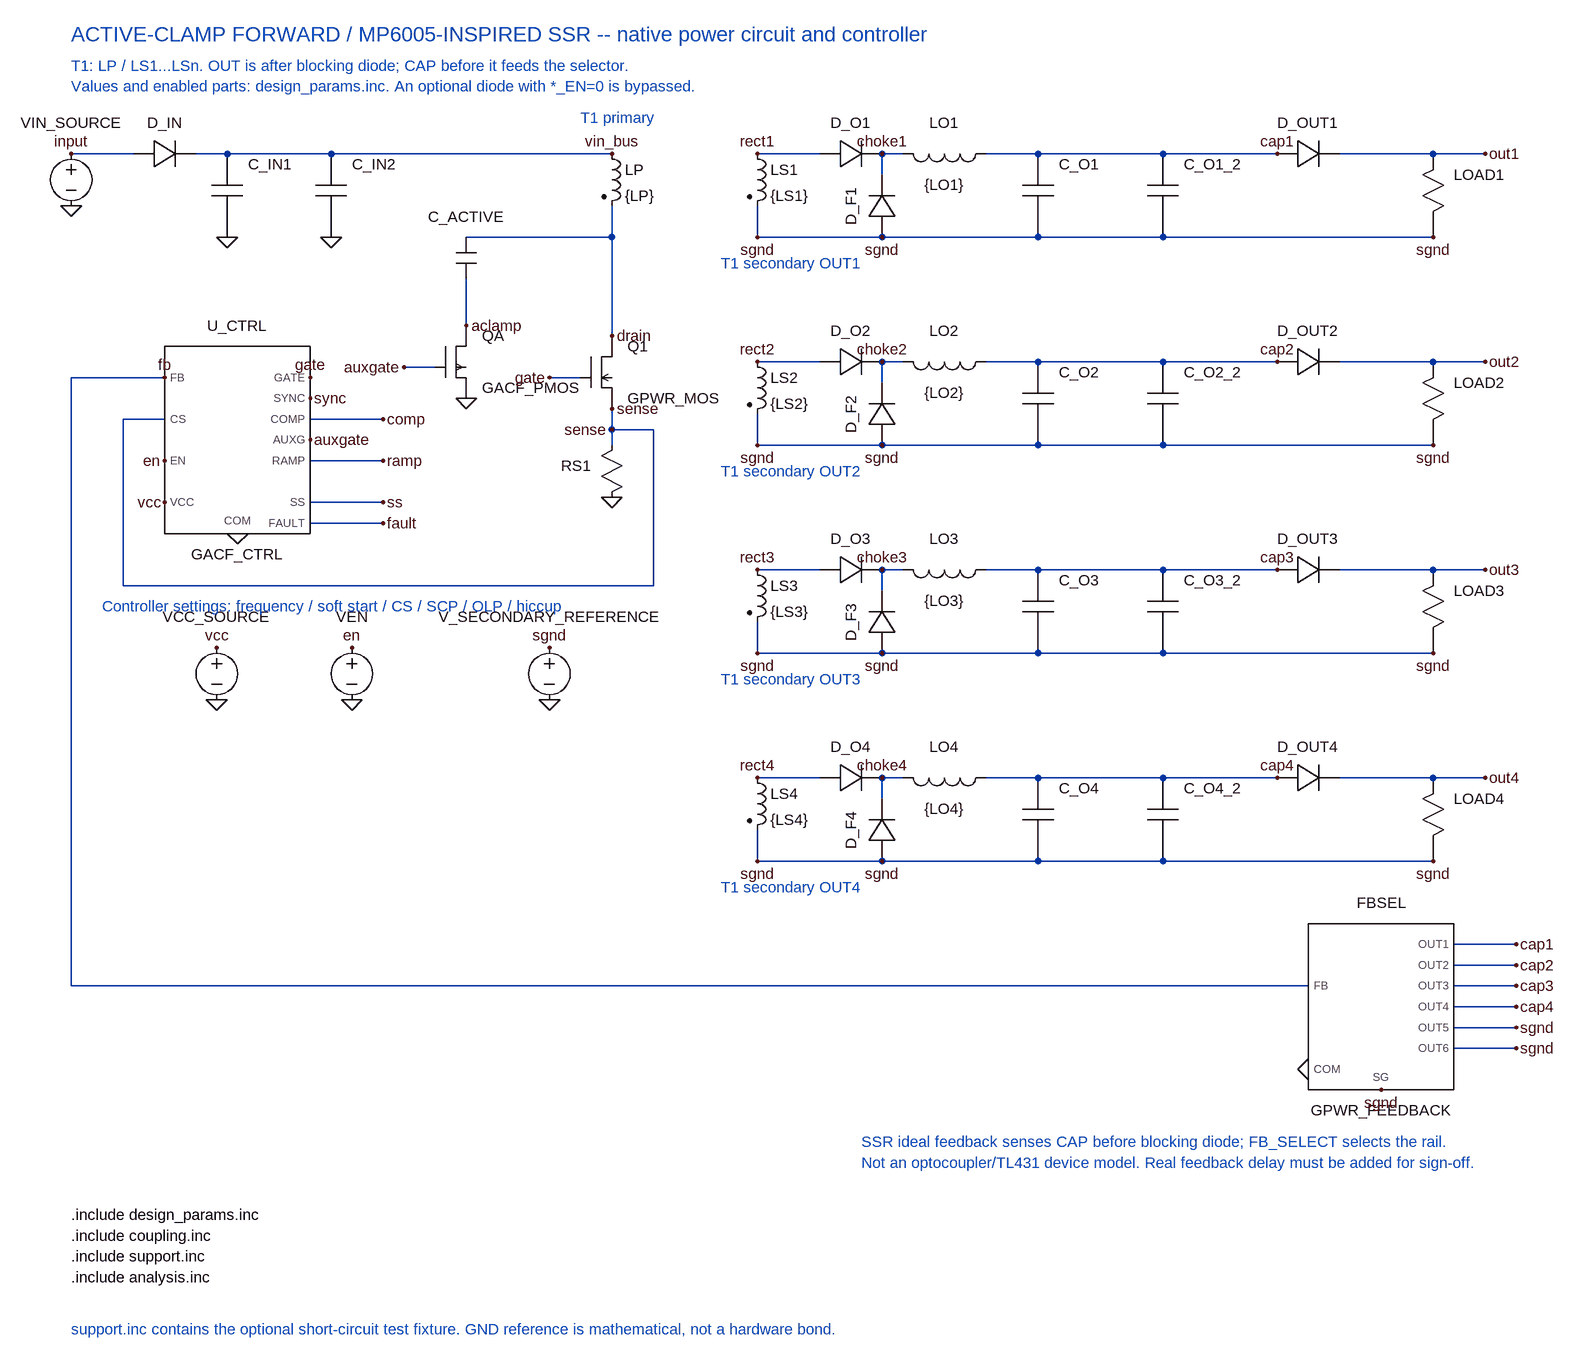
[diagram p0: schematic ACF_Forward_4.asc]
ACF_Forward_4.asc, the LTspice schematic file:
Version 4
SHEET 1 880 680
WIRE 64 200 160 200
WIRE 256 200 896 200
WIRE 896 280 896 480
WIRE 896 592 896 648
WIRE 208 608 144 608
WIRE 144 608 144 864
WIRE 144 864 960 864
WIRE 960 864 960 624
WIRE 960 624 896 624
WIRE 432 608 544 608
WIRE 432 672 544 672
WIRE 432 736 544 736
WIRE 432 768 544 768
WIRE 1120 200 1216 200
WIRE 1552 200 1744 200
WIRE 1744 200 1920 200
WIRE 2016 200 2160 200
WIRE 2160 200 2240 200
WIRE 1552 328 1744 328
WIRE 1744 328 2160 328
WIRE 1120 280 1120 328
WIRE 1120 328 1552 328
WIRE 1120 520 1216 520
WIRE 1552 520 1744 520
WIRE 1744 520 1920 520
WIRE 2016 520 2160 520
WIRE 2160 520 2240 520
WIRE 1552 648 1744 648
WIRE 1744 648 2160 648
WIRE 1120 600 1120 648
WIRE 1120 648 1552 648
WIRE 1120 840 1216 840
WIRE 1552 840 1744 840
WIRE 1744 840 1920 840
WIRE 2016 840 2160 840
WIRE 2160 840 2240 840
WIRE 1552 968 1744 968
WIRE 1744 968 2160 968
WIRE 1120 920 1120 968
WIRE 1120 968 1552 968
WIRE 1120 1160 1216 1160
WIRE 1552 1160 1744 1160
WIRE 1744 1160 1920 1160
WIRE 2016 1160 2160 1160
WIRE 2160 1160 2240 1160
WIRE 1552 1288 1744 1288
WIRE 1744 1288 2160 1288
WIRE 1120 1240 1120 1288
WIRE 1120 1288 1552 1288
WIRE 2192 1416 2288 1416
WIRE 2192 1448 2288 1448
WIRE 2192 1480 2288 1480
WIRE 2192 1512 2288 1512
WIRE 2192 1544 2288 1544
WIRE 2192 1576 2288 1576
WIRE 1968 1480 64 1480
WIRE 64 1480 64 544
WIRE 64 544 208 544
WIRE 672 328 896 328
WIRE 672 392 672 464
WIRE 624 528 576 528
WIRE 848 544 800 544
WIRE 1312 200 1344 200
WIRE 1472 200 1552 200
WIRE 1312 200 1312 232
WIRE 1312 520 1344 520
WIRE 1472 520 1552 520
WIRE 1312 520 1312 552
WIRE 1312 840 1344 840
WIRE 1472 840 1552 840
WIRE 1312 840 1312 872
WIRE 1312 1160 1344 1160
WIRE 1472 1160 1552 1160
WIRE 1312 1160 1312 1192
FLAG 64 280 0
FLAG 64 200 input
FLAG 896 200 vin_bus
FLAG 304 328 0
FLAG 464 328 0
FLAG 896 480 drain
FLAG 896 728 0
FLAG 896 592 sense
FLAG 432 544 gate
FLAG 896 624 sense
FLAG 544 608 comp
FLAG 544 672 ramp
FLAG 544 736 ss
FLAG 544 768 fault
FLAG 320 784 0
FLAG 208 672 en
FLAG 208 736 vcc
FLAG 288 960 vcc
FLAG 288 1040 0
FLAG 496 960 en
FLAG 496 1040 0
FLAG 1120 200 rect1
FLAG 1920 200 cap1
FLAG 2240 200 out1
FLAG 1120 328 sgnd
FLAG 2160 328 sgnd
FLAG 1120 520 rect2
FLAG 1920 520 cap2
FLAG 2240 520 out2
FLAG 1120 648 sgnd
FLAG 2160 648 sgnd
FLAG 1120 840 rect3
FLAG 1920 840 cap3
FLAG 2240 840 out3
FLAG 1120 968 sgnd
FLAG 2160 968 sgnd
FLAG 1120 1160 rect4
FLAG 1920 1160 cap4
FLAG 2240 1160 out4
FLAG 1120 1288 sgnd
FLAG 2160 1288 sgnd
FLAG 2288 1416 cap1
FLAG 2288 1448 cap2
FLAG 2288 1480 cap3
FLAG 2288 1512 cap4
FLAG 2288 1544 sgnd
FLAG 2288 1576 sgnd
FLAG 2080 1640 sgnd
FLAG 1968 1608 0
FLAG 208 544 fb
FLAG 800 960 sgnd
FLAG 800 1040 0
FLAG 672 464 aclamp
FLAG 672 576 0
FLAG 576 528 auxgate
FLAG 800 544 gate
FLAG 432 576 sync
FLAG 432 640 auxgate
FLAG 1312 200 choke1
FLAG 1312 328 sgnd
FLAG 1312 520 choke2
FLAG 1312 648 sgnd
FLAG 1312 840 choke3
FLAG 1312 968 sgnd
FLAG 1312 1160 choke4
FLAG 1312 1288 sgnd
SYMBOL PowerVoltage 64 184 R0
SYMATTR InstName VIN_SOURCE
SYMATTR Value {VIN}
SYMBOL PowerDiode 160 200 R0
SYMATTR InstName D_IN
SYMATTR Value GPWR_DIODE
SYMATTR SpiceLine VF={D_IN_VF} ACT={D_IN_EN} CJ={DIODE_CJ}
SYMBOL ind2 880 184 R0
SYMATTR InstName LP
SYMATTR Value {LP}
SYMATTR SpiceLine Rser={RP}
SYMBOL PowerCap 288 200 R0
SYMATTR InstName C_IN1
SYMATTR Value GPWR_CAP
SYMATTR SpiceLine C={C_IN1_C} ESR={C_IN1_ESR} ESL={C_IN1_ESL} ACT={C_IN1_EN}
SYMBOL PowerCap 448 200 R0
SYMATTR InstName C_IN2
SYMATTR Value GPWR_CAP
SYMATTR SpiceLine C={C_IN2_C} ESR={C_IN2_ESR} ESL={C_IN2_ESL} ACT={C_IN2_EN}
SYMBOL PowerMos 848 480 R0
SYMATTR InstName Q1
SYMATTR Value GPWR_MOS
SYMATTR SpiceLine RON={Q_RON} COSS={Q_COSS} CG={Q_CG} VG={VG} CJ={DIODE_CJ}
SYMBOL PowerSenseRes 880 632 R0
SYMATTR InstName RS1
SYMATTR Value {RSENSE}
SYMBOL GACF_CTRL 320 640 R0
SYMATTR InstName U_CTRL
SYMATTR Value GACF_CTRL
SYMATTR SpiceLine FSW={FSW} MODE={MODE} DMAX={DMAX} VM={VM} A_CS={A_CS} SLOPE={SLOPE} CS_LIM={CS_LIM} TBLANK={TBLANK} TONMIN={TONMIN} TPROP={TPROP} VG={VG} RDRV={RDRV} UVLO={UVLO} VSET={VSET} TSS={TSS} TYPE={TYPE} KP={KP} FZ1={FZ1} FP1={FP1} FZ2={FZ2} FP2={FP2} CMAX={CMAX} TEN={TEN} SSMODE={SSMODE} SSFRAC={SSFRAC} COFF={COFF} SSCLO={SSCLO} SSCHI={SSCHI} SCMODE={SCMODE} SCP={SCP} SCPBLANK={SCPBLANK} OLPEN={OLPEN} TOLP={TOLP} THOLD={THOLD} TOFF={TOFF} CS_TAU={CS_TAU} TDEAD={TDEAD} RSYNC={RSYNC}
SYMBOL PowerVoltage 288 944 R0
SYMATTR InstName VCC_SOURCE
SYMATTR Value {VG}
SYMBOL PowerVoltage 496 944 R0
SYMATTR InstName VEN
SYMATTR Value PULSE(0 1 1e-6 10e-9 10e-9 {2*TSTOP} {3*TSTOP})
SYMBOL ind2 1104 184 R0
SYMATTR InstName LS1
SYMATTR Value {LS1}
SYMATTR SpiceLine Rser={RS1}
SYMBOL PowerDiode 1216 200 R0
SYMATTR InstName D_O1
SYMATTR Value GPWR_DIODE
SYMATTR SpiceLine VF={D_O1_VF} ACT={D_O1_EN} CJ={DIODE_CJ}
SYMBOL PowerCap 1536 200 R0
SYMATTR InstName C_O1
SYMATTR Value GPWR_CAP
SYMATTR SpiceLine C={C_O1_C} ESR={C_O1_ESR} ESL={C_O1_ESL} ACT={C_O1_EN}
SYMBOL PowerCap 1728 200 R0
SYMATTR InstName C_O1_2
SYMATTR Value GPWR_CAP
SYMATTR SpiceLine C={C_O1_2_C} ESR={C_O1_2_ESR} ESL={C_O1_2_ESL} ACT={C_O1_2_EN}
SYMBOL PowerDiode 1920 200 R0
SYMATTR InstName D_OUT1
SYMATTR Value GPWR_DIODE
SYMATTR SpiceLine VF={D_OUT1_VF} ACT={D_OUT1_EN} CJ={DIODE_CJ}
SYMBOL PowerLoad 2144 200 R0
SYMATTR InstName LOAD1
SYMATTR Value I=V(out1,sgnd)/{RLOAD1}*(1+({LOAD_AFTER}-1)*limit((time-{TLOAD})/1e-6,0,1))
SYMBOL ind2 1104 504 R0
SYMATTR InstName LS2
SYMATTR Value {LS2}
SYMATTR SpiceLine Rser={RS2}
SYMBOL PowerDiode 1216 520 R0
SYMATTR InstName D_O2
SYMATTR Value GPWR_DIODE
SYMATTR SpiceLine VF={D_O2_VF} ACT={D_O2_EN} CJ={DIODE_CJ}
SYMBOL PowerCap 1536 520 R0
SYMATTR InstName C_O2
SYMATTR Value GPWR_CAP
SYMATTR SpiceLine C={C_O2_C} ESR={C_O2_ESR} ESL={C_O2_ESL} ACT={C_O2_EN}
SYMBOL PowerCap 1728 520 R0
SYMATTR InstName C_O2_2
SYMATTR Value GPWR_CAP
SYMATTR SpiceLine C={C_O2_2_C} ESR={C_O2_2_ESR} ESL={C_O2_2_ESL} ACT={C_O2_2_EN}
SYMBOL PowerDiode 1920 520 R0
SYMATTR InstName D_OUT2
SYMATTR Value GPWR_DIODE
SYMATTR SpiceLine VF={D_OUT2_VF} ACT={D_OUT2_EN} CJ={DIODE_CJ}
SYMBOL PowerLoad 2144 520 R0
SYMATTR InstName LOAD2
SYMATTR Value I=V(out2,sgnd)/{RLOAD2}*(1+({LOAD_AFTER}-1)*limit((time-{TLOAD})/1e-6,0,1))
SYMBOL ind2 1104 824 R0
SYMATTR InstName LS3
SYMATTR Value {LS3}
SYMATTR SpiceLine Rser={RS3}
SYMBOL PowerDiode 1216 840 R0
SYMATTR InstName D_O3
SYMATTR Value GPWR_DIODE
SYMATTR SpiceLine VF={D_O3_VF} ACT={D_O3_EN} CJ={DIODE_CJ}
SYMBOL PowerCap 1536 840 R0
SYMATTR InstName C_O3
SYMATTR Value GPWR_CAP
SYMATTR SpiceLine C={C_O3_C} ESR={C_O3_ESR} ESL={C_O3_ESL} ACT={C_O3_EN}
SYMBOL PowerCap 1728 840 R0
SYMATTR InstName C_O3_2
SYMATTR Value GPWR_CAP
SYMATTR SpiceLine C={C_O3_2_C} ESR={C_O3_2_ESR} ESL={C_O3_2_ESL} ACT={C_O3_2_EN}
SYMBOL PowerDiode 1920 840 R0
SYMATTR InstName D_OUT3
SYMATTR Value GPWR_DIODE
SYMATTR SpiceLine VF={D_OUT3_VF} ACT={D_OUT3_EN} CJ={DIODE_CJ}
SYMBOL PowerLoad 2144 840 R0
SYMATTR InstName LOAD3
SYMATTR Value I=V(out3,sgnd)/{RLOAD3}*(1+({LOAD_AFTER}-1)*limit((time-{TLOAD})/1e-6,0,1))
SYMBOL ind2 1104 1144 R0
SYMATTR InstName LS4
SYMATTR Value {LS4}
SYMATTR SpiceLine Rser={RS4}
SYMBOL PowerDiode 1216 1160 R0
SYMATTR InstName D_O4
SYMATTR Value GPWR_DIODE
SYMATTR SpiceLine VF={D_O4_VF} ACT={D_O4_EN} CJ={DIODE_CJ}
SYMBOL PowerCap 1536 1160 R0
SYMATTR InstName C_O4
SYMATTR Value GPWR_CAP
SYMATTR SpiceLine C={C_O4_C} ESR={C_O4_ESR} ESL={C_O4_ESL} ACT={C_O4_EN}
SYMBOL PowerCap 1728 1160 R0
SYMATTR InstName C_O4_2
SYMATTR Value GPWR_CAP
SYMATTR SpiceLine C={C_O4_2_C} ESR={C_O4_2_ESR} ESL={C_O4_2_ESL} ACT={C_O4_2_EN}
SYMBOL PowerDiode 1920 1160 R0
SYMATTR InstName D_OUT4
SYMATTR Value GPWR_DIODE
SYMATTR SpiceLine VF={D_OUT4_VF} ACT={D_OUT4_EN} CJ={DIODE_CJ}
SYMBOL PowerLoad 2144 1160 R0
SYMATTR InstName LOAD4
SYMATTR Value I=V(out4,sgnd)/{RLOAD4}*(1+({LOAD_AFTER}-1)*limit((time-{TLOAD})/1e-6,0,1))
SYMBOL FeedbackSelector 2080 1512 R0
SYMATTR InstName FBSEL
SYMATTR Value GPWR_FEEDBACK
SYMATTR SpiceLine SEL={FB_SELECT} H={FB_SCALE}
SYMBOL PowerVoltage 800 944 R0
SYMATTR InstName V_SECONDARY_REFERENCE
SYMATTR Value 0
SYMBOL PowerSmallCap 656 328 R0
SYMATTR InstName C_ACTIVE
SYMATTR Value {C_ACTIVE}
SYMATTR SpiceLine Rser={ESR_ACTIVE}
SYMBOL PowerPmos 624 464 R0
SYMATTR InstName QA
SYMATTR Value GACF_PMOS
SYMATTR SpiceLine RON={QA_RON} COSS={QA_COSS} CG={QA_CG} VG={VG} CJ={DIODE_CJ}
SYMBOL PowerChoke 1344 200 R0
SYMATTR InstName LO1
SYMATTR Value {LO1}
SYMATTR SpiceLine Rser=0
SYMBOL PowerDiode 1312 328 R270
SYMATTR InstName D_F1
SYMATTR Value GPWR_DIODE
SYMATTR SpiceLine VF={D_O1_VF} CJ={DIODE_CJ}
SYMBOL PowerChoke 1344 520 R0
SYMATTR InstName LO2
SYMATTR Value {LO2}
SYMATTR SpiceLine Rser=0
SYMBOL PowerDiode 1312 648 R270
SYMATTR InstName D_F2
SYMATTR Value GPWR_DIODE
SYMATTR SpiceLine VF={D_O2_VF} CJ={DIODE_CJ}
SYMBOL PowerChoke 1344 840 R0
SYMATTR InstName LO3
SYMATTR Value {LO3}
SYMATTR SpiceLine Rser=0
SYMBOL PowerDiode 1312 968 R270
SYMATTR InstName D_F3
SYMATTR Value GPWR_DIODE
SYMATTR SpiceLine VF={D_O3_VF} CJ={DIODE_CJ}
SYMBOL PowerChoke 1344 1160 R0
SYMATTR InstName LO4
SYMATTR Value {LO4}
SYMATTR SpiceLine Rser=0
SYMBOL PowerDiode 1312 1288 R270
SYMATTR InstName D_F4
SYMATTR Value GPWR_DIODE
SYMATTR SpiceLine VF={D_O4_VF} CJ={DIODE_CJ}
TEXT 64 16 Left 3 ;ACTIVE-CLAMP FORWARD / MP6005-INSPIRED SSR -- native power circuit and controller
TEXT 64 64 Left 2 ;T1: LP / LS1...LSn. OUT is after blocking diode; CAP before it feeds the selector.
TEXT 64 96 Left 2 ;Values and enabled parts: design_params.inc. An optional diode with *_EN=0 is bypassed.
TEXT 848 144 Left 2 ;T1 primary
TEXT 112 896 Left 2 ;Controller settings: frequency / soft start / CS / SCP / OLP / hiccup
TEXT 1064 368 Left 2 ;T1 secondary OUT1
TEXT 1064 688 Left 2 ;T1 secondary OUT2
TEXT 1064 1008 Left 2 ;T1 secondary OUT3
TEXT 1064 1328 Left 2 ;T1 secondary OUT4
TEXT 1280 1720 Left 2 ;SSR ideal feedback senses CAP before blocking diode; FB_SELECT selects the rail.
TEXT 1280 1752 Left 2 ;Not an optocoupler/TL431 device model. Real feedback delay must be added for sign-off.
TEXT 64 1832 Left 2 !.include design_params.inc
TEXT 64 1864 Left 2 !.include coupling.inc
TEXT 64 1896 Left 2 !.include support.inc
TEXT 64 1928 Left 2 !.include analysis.inc
TEXT 64 2008 Left 2 ;support.inc contains the optional short-circuit test fixture. GND reference is mathematical, not a hardware bond.

The netlist it stands for:
* ACF_Forward_4.asc
VIN_SOURCE input 0 {VIN}
XD_IN input vin_bus GPWR_DIODE VF={D_IN_VF} ACT={D_IN_EN} CJ={DIODE_CJ}  ; pins A K
LP vin_bus drain {LP} Rser={RP}
XC_IN1 vin_bus 0 GPWR_CAP C={C_IN1_C} ESR={C_IN1_ESR} ESL={C_IN1_ESL} ACT={C_IN1_EN}  ; pins P N
XC_IN2 vin_bus 0 GPWR_CAP C={C_IN2_C} ESR={C_IN2_ESR} ESL={C_IN2_ESL} ACT={C_IN2_EN}  ; pins P N
XQ1 drain gate sense GPWR_MOS RON={Q_RON} COSS={Q_COSS} CG={Q_CG} VG={VG} CJ={DIODE_CJ}  ; pins D G S
RS1 sense 0 {RSENSE}
XU_CTRL fb sense en vcc gate comp ramp ss fault 0 sync auxgate GACF_CTRL FSW={FSW} MODE={MODE} DMAX={DMAX} VM={VM} A_CS={A_CS} SLOPE={SLOPE} CS_LIM={CS_LIM} TBLANK={TBLANK} TONMIN={TONMIN} TPROP={TPROP} VG={VG} RDRV={RDRV} UVLO={UVLO} VSET={VSET} TSS={TSS} TYPE={TYPE} KP={KP} FZ1={FZ1} FP1={FP1} FZ2={FZ2} FP2={FP2} CMAX={CMAX} TEN={TEN} SSMODE={SSMODE} SSFRAC={SSFRAC} COFF={COFF} SSCLO={SSCLO} SSCHI={SSCHI} SCMODE={SCMODE} SCP={SCP} SCPBLANK={SCPBLANK} OLPEN={OLPEN} TOLP={TOLP} THOLD={THOLD} TOFF={TOFF} CS_TAU={CS_TAU} TDEAD={TDEAD} RSYNC={RSYNC}  ; pins FB CS EN VCC GATE COMP RAMP SS FAULT COM SYNC AUXG
VCC_SOURCE vcc 0 {VG}
VEN en 0 PULSE(0 1 1e-6 10e-9 10e-9 {2*TSTOP} {3*TSTOP})
LS1 rect1 sgnd {LS1} Rser={RS1}
XD_O1 rect1 choke1 GPWR_DIODE VF={D_O1_VF} ACT={D_O1_EN} CJ={DIODE_CJ}  ; pins A K
XC_O1 cap1 sgnd GPWR_CAP C={C_O1_C} ESR={C_O1_ESR} ESL={C_O1_ESL} ACT={C_O1_EN}  ; pins P N
XC_O1_2 cap1 sgnd GPWR_CAP C={C_O1_2_C} ESR={C_O1_2_ESR} ESL={C_O1_2_ESL} ACT={C_O1_2_EN}  ; pins P N
XD_OUT1 cap1 out1 GPWR_DIODE VF={D_OUT1_VF} ACT={D_OUT1_EN} CJ={DIODE_CJ}  ; pins A K
B§LOAD1 out1 sgnd I=V(out1,sgnd)/{RLOAD1}*(1+({LOAD_AFTER}-1)*limit((time-{TLOAD})/1e-6,0,1))
LS2 rect2 sgnd {LS2} Rser={RS2}
XD_O2 rect2 choke2 GPWR_DIODE VF={D_O2_VF} ACT={D_O2_EN} CJ={DIODE_CJ}  ; pins A K
XC_O2 cap2 sgnd GPWR_CAP C={C_O2_C} ESR={C_O2_ESR} ESL={C_O2_ESL} ACT={C_O2_EN}  ; pins P N
XC_O2_2 cap2 sgnd GPWR_CAP C={C_O2_2_C} ESR={C_O2_2_ESR} ESL={C_O2_2_ESL} ACT={C_O2_2_EN}  ; pins P N
XD_OUT2 cap2 out2 GPWR_DIODE VF={D_OUT2_VF} ACT={D_OUT2_EN} CJ={DIODE_CJ}  ; pins A K
B§LOAD2 out2 sgnd I=V(out2,sgnd)/{RLOAD2}*(1+({LOAD_AFTER}-1)*limit((time-{TLOAD})/1e-6,0,1))
LS3 rect3 sgnd {LS3} Rser={RS3}
XD_O3 rect3 choke3 GPWR_DIODE VF={D_O3_VF} ACT={D_O3_EN} CJ={DIODE_CJ}  ; pins A K
XC_O3 cap3 sgnd GPWR_CAP C={C_O3_C} ESR={C_O3_ESR} ESL={C_O3_ESL} ACT={C_O3_EN}  ; pins P N
XC_O3_2 cap3 sgnd GPWR_CAP C={C_O3_2_C} ESR={C_O3_2_ESR} ESL={C_O3_2_ESL} ACT={C_O3_2_EN}  ; pins P N
XD_OUT3 cap3 out3 GPWR_DIODE VF={D_OUT3_VF} ACT={D_OUT3_EN} CJ={DIODE_CJ}  ; pins A K
B§LOAD3 out3 sgnd I=V(out3,sgnd)/{RLOAD3}*(1+({LOAD_AFTER}-1)*limit((time-{TLOAD})/1e-6,0,1))
LS4 rect4 sgnd {LS4} Rser={RS4}
XD_O4 rect4 choke4 GPWR_DIODE VF={D_O4_VF} ACT={D_O4_EN} CJ={DIODE_CJ}  ; pins A K
XC_O4 cap4 sgnd GPWR_CAP C={C_O4_C} ESR={C_O4_ESR} ESL={C_O4_ESL} ACT={C_O4_EN}  ; pins P N
XC_O4_2 cap4 sgnd GPWR_CAP C={C_O4_2_C} ESR={C_O4_2_ESR} ESL={C_O4_2_ESL} ACT={C_O4_2_EN}  ; pins P N
XD_OUT4 cap4 out4 GPWR_DIODE VF={D_OUT4_VF} ACT={D_OUT4_EN} CJ={DIODE_CJ}  ; pins A K
B§LOAD4 out4 sgnd I=V(out4,sgnd)/{RLOAD4}*(1+({LOAD_AFTER}-1)*limit((time-{TLOAD})/1e-6,0,1))
XFBSEL cap1 cap2 cap3 cap4 sgnd sgnd sgnd fb 0 GPWR_FEEDBACK SEL={FB_SELECT} H={FB_SCALE}  ; pins OUT1 OUT2 OUT3 OUT4 OUT5 OUT6 SG FB COM
V_SECONDARY_REFERENCE sgnd 0 0
C_ACTIVE drain aclamp {C_ACTIVE} Rser={ESR_ACTIVE}
XQA aclamp auxgate 0 GACF_PMOS RON={QA_RON} COSS={QA_COSS} CG={QA_CG} VG={VG} CJ={DIODE_CJ}  ; pins D G S
LO1 choke1 cap1 {LO1} Rser=0
XD_F1 sgnd choke1 GPWR_DIODE VF={D_O1_VF} CJ={DIODE_CJ}  ; pins A K
LO2 choke2 cap2 {LO2} Rser=0
XD_F2 sgnd choke2 GPWR_DIODE VF={D_O2_VF} CJ={DIODE_CJ}  ; pins A K
LO3 choke3 cap3 {LO3} Rser=0
XD_F3 sgnd choke3 GPWR_DIODE VF={D_O3_VF} CJ={DIODE_CJ}  ; pins A K
LO4 choke4 cap4 {LO4} Rser=0
XD_F4 sgnd choke4 GPWR_DIODE VF={D_O4_VF} CJ={DIODE_CJ}  ; pins A K
* ACTIVE-CLAMP FORWARD / MP6005-INSPIRED SSR -- native power circuit and controller
* T1: LP / LS1...LSn. OUT is after blocking diode; CAP before it feeds the selector.
* Values and enabled parts: design_params.inc. An optional diode with *_EN=0 is bypassed.
* T1 primary
* Controller settings: frequency / soft start / CS / SCP / OLP / hiccup
* T1 secondary OUT1
* T1 secondary OUT2
* T1 secondary OUT3
* T1 secondary OUT4
* SSR ideal feedback senses CAP before blocking diode; FB_SELECT selects the rail.
* Not an optocoupler/TL431 device model. Real feedback delay must be added for sign-off.
.include design_params.inc
.include coupling.inc
.include support.inc
.include analysis.inc
* support.inc contains the optional short-circuit test fixture. GND reference is mathematical, not a hardware bond.
.lib GenericFlybackPWM.lib
.lib GenericACF_MP6005.lib
.backanno
.end